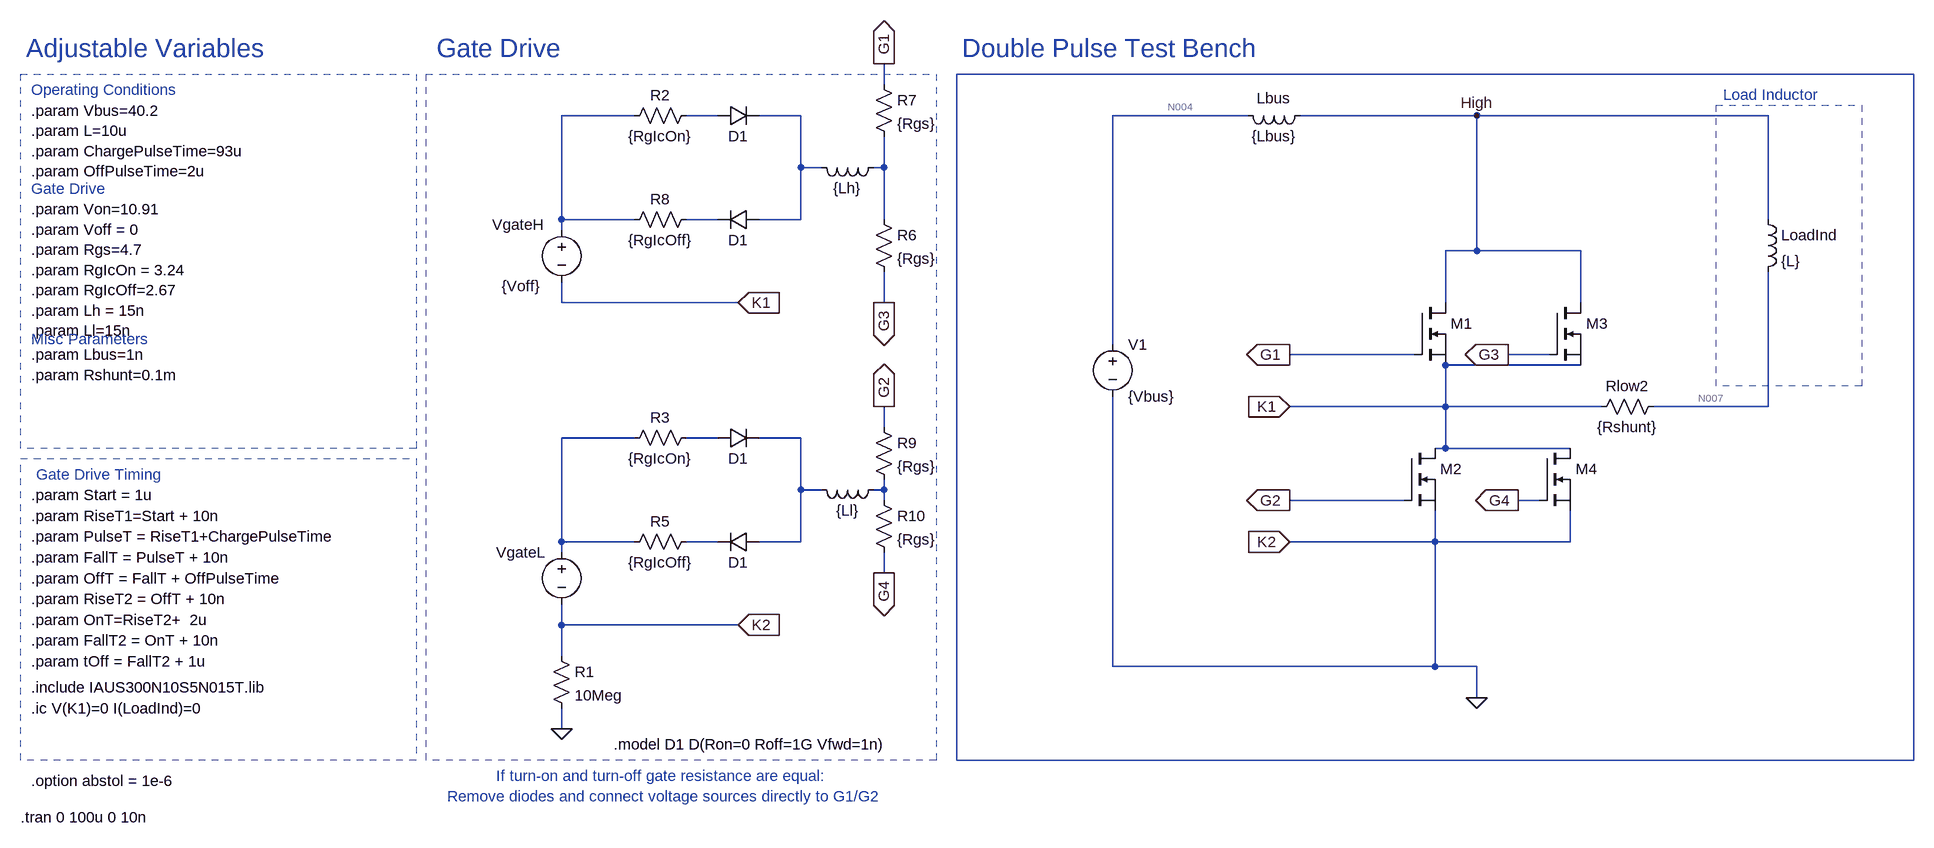
[diagram p0: schematic DPT_BIG_FOC.asc]
DPT_BIG_FOC.asc, the LTspice schematic file:
Version 4.1
SHEET 1 3124 1380
WIRE -704 -192 -704 -224
WIRE -1088 -144 -1200 -144
WIRE -960 -144 -1008 -144
WIRE -832 -144 -896 -144
WIRE -144 -144 -352 -144
WIRE 208 -144 -64 -144
WIRE 656 -144 208 -144
WIRE -832 -64 -832 -144
WIRE -800 -64 -832 -64
WIRE -704 -64 -704 -112
WIRE -704 -64 -720 -64
WIRE -1200 16 -1200 -144
WIRE -1088 16 -1200 16
WIRE -960 16 -1008 16
WIRE -832 16 -832 -64
WIRE -832 16 -896 16
WIRE -704 16 -704 -64
WIRE 656 16 656 -144
WIRE -1200 32 -1200 16
WIRE 208 64 208 -144
WIRE 208 64 160 64
WIRE 368 64 208 64
WIRE -1200 144 -1200 112
WIRE -928 144 -1200 144
WIRE -704 144 -704 96
WIRE 160 144 160 64
WIRE 368 144 368 64
WIRE -352 208 -352 -144
WIRE 112 224 -80 224
WIRE 320 224 256 224
WIRE 368 240 160 240
WIRE 160 304 160 240
WIRE 160 304 -80 304
WIRE 400 304 160 304
WIRE 656 304 656 96
WIRE 656 304 480 304
WIRE -704 336 -704 304
WIRE -1088 352 -1200 352
WIRE -960 352 -1008 352
WIRE -832 352 -896 352
WIRE 160 368 160 304
WIRE 160 368 144 368
WIRE 352 368 160 368
WIRE -832 432 -832 352
WIRE -800 432 -832 432
WIRE -704 432 -704 416
WIRE -704 432 -720 432
WIRE -704 448 -704 432
WIRE 96 448 -80 448
WIRE 304 448 272 448
WIRE -1200 512 -1200 352
WIRE -1088 512 -1200 512
WIRE -960 512 -1008 512
WIRE -832 512 -832 432
WIRE -832 512 -896 512
WIRE 144 512 144 464
WIRE 144 512 -80 512
WIRE 352 512 352 464
WIRE 352 512 144 512
WIRE -1200 528 -1200 512
WIRE -704 560 -704 528
WIRE -1200 640 -1200 608
WIRE -928 640 -1200 640
WIRE -1200 688 -1200 640
WIRE -352 704 -352 288
WIRE 144 704 144 512
WIRE 144 704 -352 704
WIRE 208 704 144 704
WIRE 208 752 208 704
WIRE -1200 800 -1200 768
FLAG 208 752 0
FLAG -928 640 K2
IOPIN -928 640 In
FLAG -80 224 G1
IOPIN -80 224 Out
FLAG -80 448 G2
IOPIN -80 448 Out
FLAG 208 -144 High
FLAG -80 304 K1
IOPIN -80 304 In
FLAG -80 512 K2
IOPIN -80 512 In
FLAG -1200 800 0
FLAG -928 144 K1
IOPIN -928 144 In
FLAG 256 224 G3
IOPIN 256 224 Out
FLAG 272 448 G4
IOPIN 272 448 Out
FLAG -704 144 G3
IOPIN -704 144 Out
FLAG -704 -224 G1
IOPIN -704 -224 Out
FLAG -704 304 G2
IOPIN -704 304 Out
FLAG -704 560 G4
IOPIN -704 560 Out
SYMBOL ind -48 -160 R90
WINDOW 0 5 56 VBottom 2
WINDOW 3 32 56 VTop 2
SYMATTR InstName Lbus
SYMATTR Value {Lbus}
SYMATTR SpiceLine Rser=0
SYMBOL ind 640 0 R0
SYMATTR InstName LoadInd
SYMATTR Value {L}
SYMATTR SpiceLine Rser=0.15
SYMBOL res -992 336 R90
WINDOW 0 0 56 VBottom 2
WINDOW 3 32 56 VTop 2
SYMATTR InstName R3
SYMATTR Value {RgIcOn}
SYMBOL voltage -1200 512 M0
WINDOW 123 0 0 Left 2
WINDOW 39 24 44 Left 2
WINDOW 3 24 44 Invisible 2
SYMATTR Value PWL(0u {Voff} {Start} {Voff} {RiseT1} {Von} {PulseT} {Von} {FallT} {Voff} {offT} {Voff} {RiseT2} {Von} {OnT} {Von} {FallT2} {Voff})
SYMATTR InstName VgateL
SYMBOL voltage -352 192 R0
SYMATTR InstName V1
SYMATTR Value {Vbus}
SYMBOL res -1216 672 R0
SYMATTR InstName R1
SYMATTR Value 10Meg
SYMBOL res -992 496 R90
WINDOW 0 0 56 VBottom 2
WINDOW 3 32 56 VTop 2
SYMATTR InstName R5
SYMATTR Value {RgIcOff}
SYMBOL res -992 -160 R90
WINDOW 0 0 56 VBottom 2
WINDOW 3 32 56 VTop 2
SYMATTR InstName R2
SYMATTR Value {RgIcOn}
SYMBOL diode -960 -128 R270
WINDOW 0 32 32 Invisible 2
WINDOW 3 0 32 VBottom 2
SYMATTR InstName D3
SYMATTR Value D1
SYMBOL res -992 0 R90
WINDOW 0 0 56 VBottom 2
WINDOW 3 32 56 VTop 2
SYMATTR InstName R8
SYMATTR Value {RgIcOff}
SYMBOL voltage -1200 16 R0
WINDOW 0 -107 8 Left 2
WINDOW 3 -92 102 Left 2
SYMATTR InstName VgateH
SYMATTR Value {Voff}
SYMBOL diode -896 0 R90
WINDOW 0 0 32 Invisible 2
WINDOW 3 32 32 VTop 2
SYMATTR InstName D1
SYMATTR Value D1
SYMBOL diode -960 368 R270
WINDOW 0 32 32 Invisible 2
WINDOW 3 0 32 VBottom 2
SYMATTR InstName D2
SYMATTR Value D1
SYMBOL diode -896 496 R90
WINDOW 0 0 32 Invisible 2
WINDOW 3 32 32 VTop 2
SYMATTR InstName D4
SYMATTR Value D1
SYMBOL ind -704 -80 R90
WINDOW 0 5 56 Invisible 2
WINDOW 3 32 56 VTop 2
SYMATTR InstName L1
SYMATTR Value {Lh}
SYMATTR SpiceLine Rser=0
SYMBOL ind -704 416 R90
WINDOW 0 5 56 Invisible 2
WINDOW 3 32 56 VTop 2
SYMATTR InstName L2
SYMATTR Value {Ll}
SYMATTR SpiceLine Rser=0
SYMBOL nmos 112 144 R0
WINDOW 3 -55 -96 Invisible 2
SYMATTR Value IAUS300N10S5N015T_L1
SYMATTR InstName M1
SYMATTR Prefix X
SYMBOL nmos 96 368 R0
WINDOW 3 -326 -261 Invisible 2
SYMATTR Value IAUS300N10S5N015T_L1
SYMATTR InstName M2
SYMATTR Prefix X
SYMBOL nmos 320 144 R0
WINDOW 3 -555 -64 Invisible 2
SYMATTR Value IAUS300N10S5N015T_L1
SYMATTR InstName M3
SYMATTR Prefix X
SYMBOL nmos 304 368 R0
WINDOW 3 -531 -227 Invisible 2
SYMATTR Value IAUS300N10S5N015T_L1
SYMATTR InstName M4
SYMATTR Prefix X
SYMBOL res -720 0 R0
SYMATTR InstName R6
SYMATTR Value {Rgs}
SYMBOL res -720 -208 R0
SYMATTR InstName R7
SYMATTR Value {Rgs}
SYMBOL res -720 320 R0
SYMATTR InstName R9
SYMATTR Value {Rgs}
SYMBOL res -720 432 R0
SYMATTR InstName R10
SYMATTR Value {Rgs}
SYMBOL res 496 288 R90
WINDOW 0 0 56 VBottom 2
WINDOW 3 32 56 VTop 2
SYMATTR InstName Rlow2
SYMATTR Value {Rshunt}
TEXT 736 -176 Right 2 ;Load Inductor
TEXT -2016 696 Left 2 !.param tOff = FallT2 + 1u
TEXT -2016 440 Left 2 !.param Start = 1u
TEXT -2016 504 Left 2 !.param PulseT = RiseT1+ChargePulseTime
TEXT -2016 536 Left 2 !.param FallT = PulseT + 10n
TEXT -2016 568 Left 2 !.param OffT = FallT + OffPulseTime
TEXT -2016 600 Left 2 !.param RiseT2 = OffT + 10n
TEXT -2016 632 Left 2 !.param OnT=RiseT2+  2u
TEXT -2016 664 Left 2 !.param FallT2 = OnT + 10n
TEXT -2016 472 Left 2 !.param RiseT1=Start + 10n
TEXT -2008 408 Left 2 ;Gate Drive Timing
TEXT -1392 -248 Left 4 ;Gate Drive
TEXT -2024 -248 Left 4 ;Adjustable Variables
TEXT -584 -248 Left 4 ;Double Pulse Test Bench
TEXT -2016 224 Left 2 !.param Lbus=1n\n.param Rshunt=0.1m
TEXT -2016 0 Left 2 !.param Von=10.91\n.param Voff = 0\n.param Rgs=4.7\n.param RgIcOn = 3.24\n.param RgIcOff=2.67\n.param Lh = 15n\n.param Ll=15n
TEXT -2016 -152 Left 2 !.param Vbus=40.2\n.param L=10u\n.param ChargePulseTime=93u\n.param OffPulseTime=2u
TEXT -2016 -184 Left 2 ;Operating Conditions
TEXT -2016 -32 Left 2 ;Gate Drive
TEXT -2016 200 Left 2 ;Misc Parameters
TEXT -1120 824 Left 2 !.model D1 D(Ron=0 Roff=1G Vfwd=1n)
TEXT -1040 888 Center 2 ;If turn-on and turn-off gate resistance are equal: \nRemove diodes and connect voltage sources directly to G1/G2
TEXT -2016 880 Left 2 !.option abstol = 1e-6
TEXT -2016 736 Left 2 !.include IAUS300N10S5N015T.lib
TEXT -2032 936 Left 2 !.tran 0 100u 0 10n
TEXT -2016 768 Left 2 !.ic V(K1)=0 I(LoadInd)=0
RECTANGLE Normal -624 848 -1408 -208 2
RECTANGLE Normal 800 272 576 -160 1
RECTANGLE Normal -1424 368 -2032 -208 2
RECTANGLE Normal 880 848 -592 -208
RECTANGLE Normal -1424 848 -2032 384 2

The netlist it stands for:
* DPT_BIG_FOC.asc
Lbus High N004 {Lbus} Rser=0
LoadInd High N007 {L} Rser=0.15
R3 N009 N008 {RgIcOn}
VgateL N008 0 PWL(0u {Voff} {Start} {Voff} {RiseT1} {Von} {PulseT} {Von} {FallT} {Voff} {offT} {Voff} {RiseT2} {Von} {OnT} {Von} {FallT2} {Voff})
V1 N004 0 {Vbus}
R1 0 0 10Meg
R5 N012 N008 {RgIcOff}
R2 N002 N001 {RgIcOn}
D3 N002 N003 D1
R8 N006 N001 {RgIcOff}
VgateH N001 K1 {Voff}
D1 N003 N006 D1
D2 N009 N010 D1
D4 N010 N012 D1
L1 N005 N003 {Lh} Rser=0
L2 N011 N010 {Ll} Rser=0
X§M1 High G1 K1 IAUS300N10S5N015T_L1  ; pins D G S
X§M2 K1 G2 0 IAUS300N10S5N015T_L1  ; pins D G S
X§M3 High G3 K1 IAUS300N10S5N015T_L1  ; pins D G S
X§M4 K1 G4 0 IAUS300N10S5N015T_L1  ; pins D G S
R6 N005 G3 {Rgs}
R7 G1 N005 {Rgs}
R9 G2 N011 {Rgs}
R10 N011 G4 {Rgs}
Rlow2 N007 K1 {Rshunt}
.model D D
.lib standard.dio
* Load Inductor
.param tOff = FallT2 + 1u
.param Start = 1u
.param PulseT = RiseT1+ChargePulseTime
.param FallT = PulseT + 10n
.param OffT = FallT + OffPulseTime
.param RiseT2 = OffT + 10n
.param OnT=RiseT2+  2u
.param FallT2 = OnT + 10n
.param RiseT1=Start + 10n
* Gate Drive Timing
* Gate Drive
* Adjustable Variables
* Double Pulse Test Bench
.param Lbus=1n
.param Rshunt=0.1m
.param Von=10.91
.param Voff = 0
.param Rgs=4.7
.param RgIcOn = 3.24
.param RgIcOff=2.67
.param Lh = 15n
.param Ll=15n
.param Vbus=40.2
.param L=10u
.param ChargePulseTime=93u
.param OffPulseTime=2u
* Operating Conditions
* Gate Drive
* Misc Parameters
.model D1 D(Ron=0 Roff=1G Vfwd=1n)
* If turn-on and turn-off gate resistance are equal:
* Remove diodes and connect voltage sources directly to G1/G2
.option abstol = 1e-6
.include IAUS300N10S5N015T.lib
.tran 0 100u 0 10n
.ic V(K1)=0 I(LoadInd)=0
.backanno
.end

* Results of the author's LTspice run, read from the files saved beside the schematic
* Operating Point, zero values left out:
*   V(high) = 40.2 V
*   V(n004) = 40.2 V
*   V(n007) = 40.6 nV
*   I(Lbus) = -406.3 µA
*   I(LoadInd) = 406 µA
*   I(Rlow2) = 406 µA
*   I(V1) = -406.3 µA
*   Ix(m1:drain) = 160.8 nA
*   Ix(m1:source) = -160.9 nA
*   Ix(m3:drain) = 160.8 nA
*   Ix(m3:source) = -160.9 nA
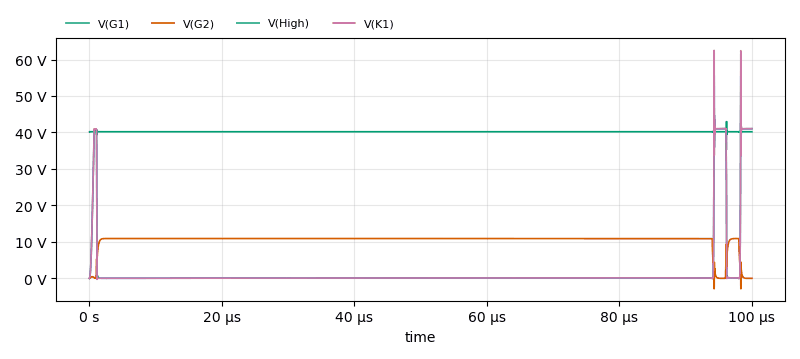
[diagram p1: Transient Analysis of DPT_BIG_FOC.asc, plotted from the saved traces]
* Transient Analysis, 1 run:
*   V(G1): min -55.63 mV, max 55.51 V, average 1.844 V, rms 8.379 V, last 41.03 V
*   V(G2): min -2.874 V, max 10.91 V, average 10.36 V, rms 10.61 V, last 23.2 µV
*   V(High): min 35.29 V, max 47.38 V, average 40.2 V, rms 40.2 V, last 40.2 V
*   V(K1): min -286.3 mV, max 62.51 V, average 1.847 V, rms 8.413 V, last 41.03 V